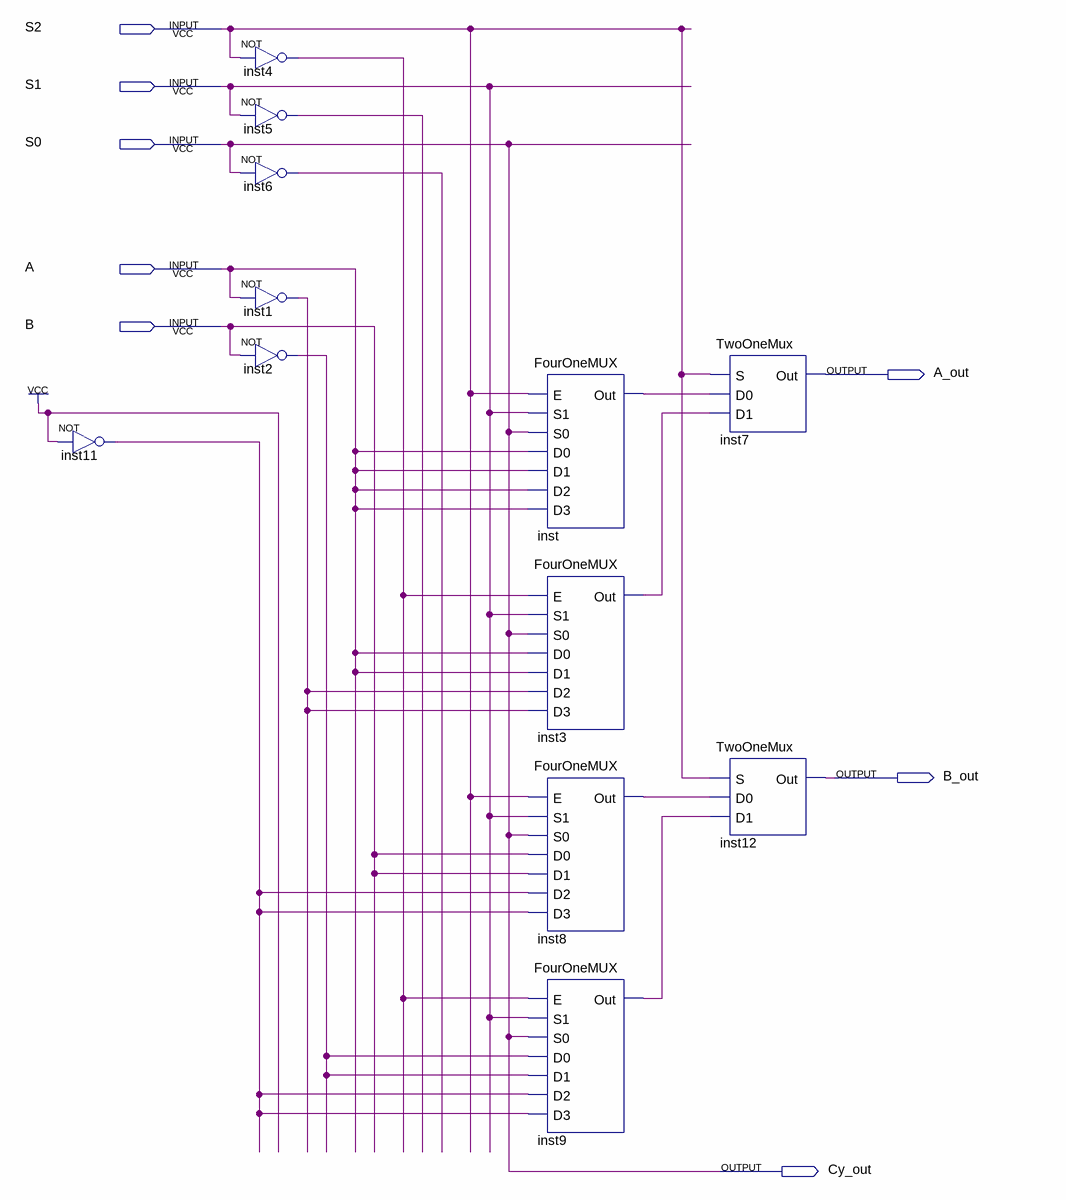
[diagram p0: schematic sheet]
// Quartus schematic 1bitArithmeticCircuit.bdf as structural Verilog: 12 symbols, 8 pins
module \1bitArithmeticCircuit  (
  input  S2,
  input  S1,
  input  S0,
  input  A,
  input  B,
  output A_out,
  output B_out,
  output Cy_out
);

  wire inst1_out, inst2_out, inst3_out, inst4_out, inst5_out, inst6_out, inst8_out, inst9_out, inst11_out,
       inst_out;

  not inst11 (inst11_out, 1'b1);
  not inst4 (inst4_out, S2);
  not inst5 (inst5_out, S1);
  not inst6 (inst6_out, S0);
  not inst1 (inst1_out, A);
  not inst2 (inst2_out, B);
  FourOneMUX inst (.E(S2), .S1(S1), .S0(S0), .D0(A), .D1(A), .D2(A), .D3(A), .Out(inst_out));
  FourOneMUX inst3 (.E(inst4_out), .S1(S1), .S0(S0), .D0(A), .D1(A), .D2(inst1_out), .D3(inst1_out), .Out(inst3_out));
  FourOneMUX inst8 (.E(S2), .S1(S1), .S0(S0), .D0(B), .D1(B), .D2(inst11_out), .D3(inst11_out), .Out(inst8_out));
  FourOneMUX inst9 (
    .E(inst4_out), .S1(S1), .S0(S0), .D0(inst2_out), .D1(inst2_out), .D2(inst11_out), .D3(inst11_out),
    .Out(inst9_out));
  TwoOneMux inst7 (.S(S2), .D0(inst_out), .D1(inst3_out), .Out(A_out));
  TwoOneMux inst12 (.S(S2), .D0(inst8_out), .D1(inst9_out), .Out(B_out));

  assign Cy_out = S0;
endmodule
